# Altium schematic sheet Connector.SchDoc
size A4; SheetNumber: 2; SheetTotal: 12
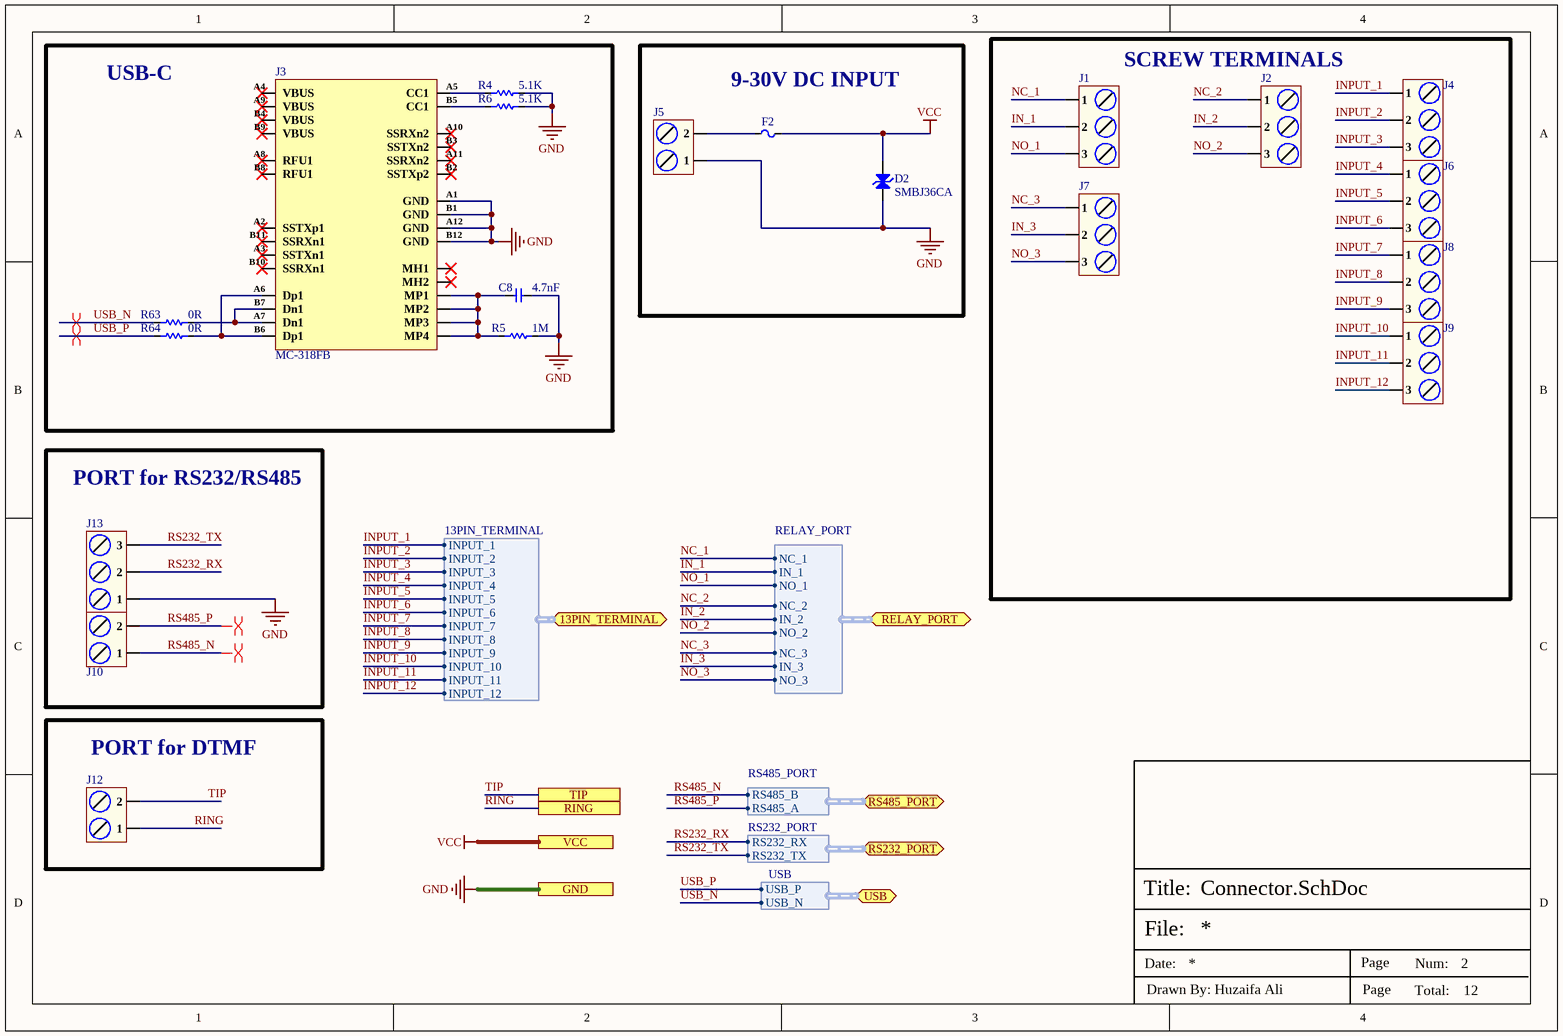
[diagram p0: Connector.SchDoc]

## Parts
C8  4.7nF  [Cap-1206]
D2  SMBJ36CA  [SMB_]
F2  SHV2920P500-30-AA  [Fuse-2920]  (value not drawn)
J1  DB128L-5.08-3P-BK-S  [DB128L-5.08-3P-BK-S]  (value not drawn)
J2  DB128L-5.08-3P-BK-S  [DB128L-5.08-3P-BK-S]  (value not drawn)
J3  MC-318FB  [MC-318FB]
J4  DB128L-5.08-3P-BK-S  [DB128L-5.08-3P-BK-S]  (value not drawn)
J5  DB128L-5.08-2P-BK-S  [DB128L-5.08-2P-BK-S]  (value not drawn)
J6  DB128L-5.08-3P-BK-S  [DB128L-5.08-3P-BK-S]  (value not drawn)
J7  DB128L-5.08-3P-BK-S  [DB128L-5.08-3P-BK-S]  (value not drawn)
J8  DB128L-5.08-3P-BK-S  [DB128L-5.08-3P-BK-S]  (value not drawn)
J9  DB128L-5.08-3P-BK-S  [DB128L-5.08-3P-BK-S]  (value not drawn)
J10  DB128L-5.08-2P-BK-S  [DB128L-5.08-2P-BK-S]  (value not drawn)
J12  DB128L-5.08-2P-BK-S  [DB128L-5.08-2P-BK-S]  (value not drawn)
J13  DB128L-5.08-3P-BK-S  [DB128L-5.08-3P-BK-S]  (value not drawn)
R4  5.1K  [Res-0402]
R5  1M  [Res-0603]
R6  5.1K  [Res-0402]
R63  0R  [Res-0402]
R64  0R  [Res-0402]

## Blocks framed on the sheet
USB-C: C8 J3 R4-R6 R63 R64
9-30V DC INPUT: D2 F2 J5
SCREW TERMINALS: J1 J2 J4 J6-J9
PORT for RS232/RS485: J10 J13
PORT for DTMF: J12

## Ports
13PIN_TERMINAL (bidir, harness 13PIN_TERMINAL), GND, RELAY_PORT (bidir, harness RELAY_PORT), RING, RS232_PORT (bidir, harness RS232_PORT), RS485_PORT (bidir, harness RS485_PORT), TIP, USB (bidir, harness USB), VCC

## Harnesses
RS485_PORT: RS485_B, RS485_A
RS232_PORT: RS232_RX, RS232_TX
RELAY_PORT: NC_1, NC_2, IN_1, IN_2, NO_1, NO_2, NC_3, IN_3, NO_3
13PIN_TERMINAL: INPUT_7, INPUT_1, INPUT_2, INPUT_8, INPUT_3, INPUT_9, INPUT_4, INPUT_10, INPUT_5, INPUT_11, INPUT_6, INPUT_12
USB: USB_P, USB_N

## Nets
GND: C8.1 D2.1(A) J3.A1(GND) J3.A12(GND) J3.B1(GND) J3.B12(GND) J5.1 J13.1 R4.2 R5.1 R6.2 ; port GND
VCC: D2.2(K) F2.2 ; port VCC
IN_1: J1.2 ; port RELAY_PORT.IN_1
IN_2: J2.2 ; port RELAY_PORT.IN_2
IN_3: J7.2 ; port RELAY_PORT.IN_3
INPUT_1: J4.1 ; port 13PIN_TERMINAL.INPUT_1
INPUT_2: J4.2 ; port 13PIN_TERMINAL.INPUT_2
INPUT_3: J4.3 ; port 13PIN_TERMINAL.INPUT_3
INPUT_4: J6.1 ; port 13PIN_TERMINAL.INPUT_4
INPUT_5: J6.2 ; port 13PIN_TERMINAL.INPUT_5
INPUT_6: J6.3 ; port 13PIN_TERMINAL.INPUT_6
INPUT_7: J8.1 ; port 13PIN_TERMINAL.INPUT_7
INPUT_8: J8.2 ; port 13PIN_TERMINAL.INPUT_8
INPUT_9: J8.3 ; port 13PIN_TERMINAL.INPUT_9
INPUT_10: J9.1 ; port 13PIN_TERMINAL.INPUT_10
INPUT_11: J9.2 ; port 13PIN_TERMINAL.INPUT_11
INPUT_12: J9.3 ; port 13PIN_TERMINAL.INPUT_12
NC_1: J1.1 ; port RELAY_PORT.NC_1
NC_2: J2.1 ; port RELAY_PORT.NC_2
NC_3: J7.1 ; port RELAY_PORT.NC_3
NO_1: J1.3 ; port RELAY_PORT.NO_1
NO_2: J2.3 ; port RELAY_PORT.NO_2
NO_3: J7.3 ; port RELAY_PORT.NO_3
RING: J12.1 ; port RING
RS232_RX: J13.2 ; port RS232_PORT.RS232_RX
RS232_TX: J13.3 ; port RS232_PORT.RS232_TX
RS485_N: J10.1 ; port RS485_PORT.RS485_B
RS485_P: J10.2 ; port RS485_PORT.RS485_A
TIP: J12.2 ; port TIP
USB_N: R63.1 ; port USB.USB_N
USB_P: R64.1 ; port USB.USB_P
NetC8_2: C8.2 J3.MP1 J3.MP2 J3.MP3 J3.MP4 R5.2
NetF2_1: F2.1 J5.2
NetJ3_A5: J3.A5(CC1) R4.1
NetJ3_A6: J3.A6(Dp1) J3.B6(Dp1) R64.2
NetJ3_A7: J3.A7(Dn1) J3.B7(Dn1) R63.2
NetJ3_B5: J3.B5(CC1) R6.1

Not connected (* = marked no-connect by the designer): J3 A2(SSTXp1)* A3(SSTXn1)* A4(VBUS)* A8(RFU1)* A9(VBUS)* A10(SSRXn2)* A11(SSRXn2)* B2(SSTXp2)* B3(SSTXn2)* B4(VBUS)* B8(RFU1)* B9(VBUS)* B10(SSRXn1)* B11(SSRXn1)* MH1* MH2*

## Layout directives
differential pair; net class RS485; differential pair class RS485_LINES; rule Impedance Constraint [Min = 115.0    Max = 120.0    ]; rule Matched Net Lengths [Tolerance = 0.508mm]: RS485_N, RS485_P
differential pair; net class USB; differential pair class USB_Lines; rule Impedance Constraint [Min = 88.00    Max = 90.00    ]; rule Matched Net Lengths [Tolerance = 20mil]: USB_N, USB_P

## Notes on the sheet
- File:
- Title:
- Date:
- Page
- Num:
- Total:
- Drawn By: Huzaifa Ali

## Library data of the parts
C8 = CC1206KKX7RCBB472: CAP CER 4700PF 1KV X7R 1206; Manufacturer: Yageo; Dielectric Material: Ceramic; Tolerance: 10%; Item Type: Capacitor; Supplier 1: Future Electronics; Manufacturer Part Number: CC1206KKX7RCBB472; RoHS: Yes; Category: Ceramic Capacitors; Stock 1: 180000; Pricing 1: 3000=0.02860, 9000=0.02750, 15000=0.02700, 45000=0.02600, 75000=0.02510 (USD); Mount: Surface Mount; Case/Package: 1206; Number of Pins: 2; Case Code (Imperial): 1206; Case Code (Metric): 3216; Weight: 0.000571oz; Min Operating Temperature: -55°C; Max Operating Temperature: 125°C; Voltage Rating: 1kV; Capacitance: 4.7nF; Packaging: Tape and Reel; Voltage Rating (DC): 1kV; Dielectric: X7R; Termination: SMD/SMT; Resistor Type: Ceramic; Series: CC; Length: 3.2mm; Width: 0.063inch; Thickness: 0.057inch; Depth: 1.6mm; Radiation Hardening: No; Lead Free: Lead Free; RoHS Compliant: Yes; ComponentLink1URL: https://datasheet.ciiva.com/13208/upy-gp-np0-16v-to-50v-8-13208693.pdf?src-supplier=Mouser; ComponentLink1Description: https://datasheet.ciiva.com/13208/upy-gp-np0-16v-to-50v-8-13208693.pdf?src-supplier=Mouser; ComponentLink2URL: https://datasheet.ciiva.com/11466/hv-11466701.pdf?src-supplier=Avnet; ComponentLink2Description: https://datasheet.ciiva.com/11466/hv-11466701.pdf?src-supplier=Avnet; Supplier Part Number 1: 7130131; LCSC Part Number: C107198
D2 = SMBJ36CA: 58.1V 40V 36V Bi-Directional SMB(DO-214AA) TVS ROHS; Manufacturer: Slkor(SLKORMICRO Elec.); Item Type: Diode; Manufacturer Part Number: SMBJ36CA; Package: SMB(DO-214AA); LCSC Part Number: C556189; ComponentLink1Description: LCSC; ComponentLink1URL: https://www.lcsc.com/product-detail/span-style-background-color-ff0-TVS-span_Slkor-SLKORMICRO-Elec-SMBJ36CA_C556189.html
F2 = SHV2920P500-30-AA: 30V 5A 5A 2920 Resettable Fuses ROHS; Manufacturer: PTTC(Polytronics Tech); Item Type: Fuse; ComponentLink1Description: LCSC; ComponentLink1URL: https://www.lcsc.com/product-detail/Resettable-Fuses_PTTC-Polytronics-Tech-SHV2920P500-30-AA_C495350.html; Manufacturer Part Number: SHV2920P500-30-AA; Package: 2920; LCSC Part Number: C495350
J1 J2 J4 J6-J9 J13 = DB128L-5.08-3P-BK-S: 1x3P 18A -40℃~+105℃ 250V Black 12~30 Straight pin 5.08mm 2.5 1 3 Plugin,P=5.08mm Screw terminal ROHS; Manufacturer: DIBO; Item Type: Terminal Block; Manufacturer Part Number: DB128L-5.08-3P-BK-S; Package: Plugin,P=5.08mm; LCSC Part Number: C430602; ComponentLink1Description: LCSC; ComponentLink1URL: https://www.lcsc.com/product-detail/Screw-terminal_DIBO-DB128L-5-08-3P-BK-S_C430602.html
J3 = MC-318FB: USB 3.0 3A 1 Brick nogging 24 Female -35℃~+75℃ Type-C SMD USB Connectors ROHS; Manufacturer: SOFNG; ComponentLink1Description: LCSC; ComponentLink1URL: https://www.lcsc.com/product-detail/USB-Connectors_SOFNG-MC-318FB_C2977724.html; Manufacturer Part Number: MC-318FB; Footprint: Custom; LCSC Part Number: C2977724
J5 J10 J12 = DB128L-5.08-2P-BK-S: 1x2P 18A -40℃~+105℃ 250V Black 12~30 Straight pin 5.08mm 2.5 1 2 Plugin,P=5.08mm Screw terminal ROHS; Manufacturer: DIBO; Item Type: Terminal Block; Manufacturer Part Number: DB128L-5.08-2P-BK-S; Package: Plugin,P=5.08mm; LCSC Part Number: C430601; ComponentLink1Description: LCSC; ComponentLink1URL: https://www.lcsc.com/product-detail/Screw-terminal_span-style-background-color-ff0-DIBO-span-DB128L-5-08-2P-BK-S_C430601.html
R4 R6 = RC0402FR-075K1L: RES 5.1K OHM 1% 1/16W 0402; Manufacturer: Yageo; Power Rating: 63mW; Resistance: 5.1kR; Temperature Coefficient: 100ppm/°C; Voltage Rating: 50V; Item Type: Resistor; Supplier 1: Avnet; Manufacturer Part Number: RC0402FR-075K1L; RoHS: Yes; Category: Chip SMD Resistors; Stock 1: 65000; Pricing 1: 10000=0.00085 (USD); Case/Package: 0402; Case Code (Metric): 1005; Case Code (Imperial): 0402; Min Operating Temperature: -55°C; Max Operating Temperature: 155°C; Tolerance: 1%; Technology: THICK FILM; Packaging: Tape and Reel; Package Quantity: 1; Resistor Type: Thick Film; Number of Terminations: 2; Termination: SMD/SMT; Max Power Dissipation: 63mW; Voltage Rating (DC): 50V; Working Voltage: 50V; Features: Moisture Resistant; Series: RC; Resistance Tolerance: 1%; Construction: Rectangular; Length: 1mm; Width: 0.02inch; Height: 0.016inch; Depth: 0.5mm; RoHS Compliant: Yes; Military Standard: Not; Lead Free: Lead Free; ComponentLink1URL: https://datasheet.ciiva.com/7983/1018594-7983519.pdf?src-supplier=Element14; ComponentLink1Description: https://datasheet.ciiva.com/7983/1018594-7983519.pdf?src-supplier=Element14; ComponentLink2URL: https://datasheet.ciiva.com/46394/1018594-46394936.pdf?src-supplier=Element14; ComponentLink2Description: https://datasheet.ciiva.com/46394/1018594-46394936.pdf?src-supplier=Element14; ComponentLink3URL: https://datasheet.ciiva.com/2453/pyu-r-int-thick-7-2453401.pdf?src-supplier=Digi-Key; ComponentLink3Description: https://datasheet.ciiva.com/2453/pyu-r-int-thick-7-2453401.pdf?src-supplier=Digi-Key; ComponentLink4URL: https://datasheet.ciiva.com/2453/pyu-r-int-thick-7-2453402.pdf?src-supplier=Digi-Key; ComponentLink4Description: https://datasheet.ciiva.com/2453/pyu-r-int-thick-7-2453402.pdf?src-supplier=Digi-Key; ComponentLink5URL: https://datasheet.ciiva.com/2453/pyu-r-int-thick-7-2453400.pdf?src-supplier=Digi-Key; ComponentLink5Description: https://datasheet.ciiva.com/2453/pyu-r-int-thick-7-2453400.pdf?src-supplier=Digi-Key; ComponentLink6URL: https://datasheet.ciiva.com/12558/pyu-rc0402-51-rohs-l-6-r-8721-12558460.pdf?src-supplier=Mouser; ComponentLink6Description: https://datasheet.ciiva.com/12558/pyu-rc0402-51-rohs-l-6-r-8721-12558460.pdf?src-supplier=Mouser; ComponentLink7URL: https://datasheet.ciiva.com/16744/pyu-rc0402-51-rohs-l-6-r-16744283.pdf?src-supplier=Future+Electronics; ComponentLink7Description: https://datasheet.ciiva.com/16744/pyu-rc0402-51-rohs-l-6-r-16744283.pdf?src-supplier=Future+Electronics; ComponentLink8URL: https://datasheet.ciiva.com/15189/getdatasheetpartid-323636-15189493.pdf?src-supplier=Verical; ComponentLink8Description: https://datasheet.ciiva.com/15189/getdatasheetpartid-323636-15189493.pdf?src-supplier=Verical; Supplier Part Number 1: RC0402FR-075K1L; LCSC Part Number: C105872
R5 = RC0603FR-071ML: RES SMD 1M OHM 1% 1/10W 0603; Manufacturer: Yageo; Voltage Rating: 50V; Resistance: 1MR; Power Rating: 100mW; Temperature Coefficient: 100ppm/°C; Item Type: Resistor; Supplier 1: Digi-Key; Manufacturer Part Number: RC0603FR-071ML; Stock 1: 3824601; Pricing 1: 1=0.1, 10=0.023, 100=0.0094, 1000=0.00421, 2500=0.00366 (USD); Case/Package: 0603; Number of Pins: 2; Case Code (Imperial): 0603; Case Code (Metric): 1608; Min Operating Temperature: -55°C; Max Operating Temperature: 155°C; Voltage Rating (DC): 50V; Tolerance: 1%; Packaging: Tape and Reel; Package Quantity: 5000; Termination: SMD/SMT; Composition: Thick Film; Military Standard: Not; Length: 1.6mm; Height: 0.45mm; Width: 0.8mm; Depth: 0.8mm; REACH SVHC: No SVHC; Lead Free: Lead Free; ComponentLink1URL: http://www.farnell.com/datasheets/2167052.pdf?src-supplier=Mouser; ComponentLink1Description: http://www.farnell.com/datasheets/2167052.pdf?src-supplier=Mouser; ComponentLink2URL: http://www.farnell.com/datasheets/2167052.pdf?src-supplier=Element14; ComponentLink2Description: http://www.farnell.com/datasheets/2167052.pdf?src-supplier=Element14; ComponentLink3URL: http://documents.rs-components.com/techlib://itc_doclist_GB.htm?stockno=5048956&src-supplier=RSComponents; ComponentLink3Description: http://documents.rs-components.com/techlib://itc_doclist_GB.htm?stockno=5048956&src-supplier=RSComponents; Supplier Part Number 1: 311-1.00MHRDKR-ND; LCSC Part Number: C105578
R63 R64 = RC0402FR-070RL: RES 0 OHM JUMPER 1/16W 0402; Manufacturer: Yageo; Tolerance: 1%; Power Rating: 62.5mW; Voltage Rating: 50V; Temperature Coefficient: 200ppm/°C; Max Power Dissipation: 63mW; Supplier 1: Mouser; Manufacturer Part Number: RC0402FR-070RL; RoHS: Yes; Category: Chip SMD Resistors; Stock 1: 8556842; Pricing 1: 1=0.10000, 10=0.01400, 50=0.01400, 100=0.00600, 1000=0.00300, 5000=0.00200, 10000=0.00100 (USD); Mount: Surface Mount; Case/Package: 0402; Contact Plating: Tin,Matte; Case Code (Imperial): 0402; Case Code (Metric): 1005; Size Code: 0402; Min Operating Temperature: -55°C; Max Operating Temperature: 155°C; Resistance: 0R; Resistor Type: Thick Film; Packaging: Tape and Reel; Termination: SMD/SMT; Features: Moisture Resistant; Series: RC; Number of Terminations: 2; Length: 1mm; Width: 0.5mm; Height: 0.35mm; Radiation Hardening: No; Lead Free: Lead Free; RoHS Compliant: Yes; ComponentLink1URL: https://datasheet.ciiva.com/8896/pyu-rc0402-51-rohs-l-6-8896149.pdf?src-supplier=Avnet; ComponentLink1Description: https://datasheet.ciiva.com/8896/pyu-rc0402-51-rohs-l-6-8896149.pdf?src-supplier=Avnet; ComponentLink2URL: https://datasheet.ciiva.com/16790/pyu-rc0402-51-rohs-l-6-r-16790444.pdf?src-supplier=Future+Electronics; ComponentLink2Description: https://datasheet.ciiva.com/16790/pyu-rc0402-51-rohs-l-6-r-16790444.pdf?src-supplier=Future+Electronics; Supplier Part Number 1: 603-RC0402FR-070RL; LCSC Part Number: C106231